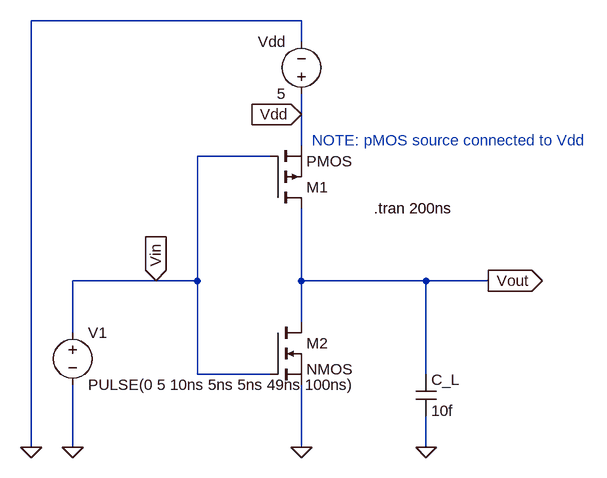
[diagram p0: schematic Inverter.asc]
Inverter.asc, the LTspice schematic file:
Version 4.1
SHEET 1 1008 680
WIRE 208 -400 -208 -400
WIRE 208 -368 208 -400
WIRE 208 -256 208 -288
WIRE 208 -208 208 -256
WIRE 160 -192 48 -192
WIRE -16 0 -144 0
WIRE 48 0 48 -192
WIRE 48 0 -16 0
WIRE 208 0 208 -112
WIRE 400 0 208 0
WIRE 496 0 400 0
WIRE 208 64 208 0
WIRE -144 80 -144 0
WIRE 48 144 48 0
WIRE 160 144 48 144
WIRE 400 144 400 0
WIRE -208 256 -208 -400
WIRE -144 256 -144 160
WIRE 208 256 208 160
WIRE 400 256 400 208
FLAG 496 0 Vout
IOPIN 496 0 Out
FLAG -16 0 Vin
IOPIN -16 0 In
FLAG -208 256 0
FLAG -144 256 0
FLAG 208 256 0
FLAG 400 256 0
FLAG 208 -256 Vdd
IOPIN 208 -256 In
SYMBOL cap 384 144 R0
SYMATTR InstName C_L
SYMATTR Value 10f
SYMBOL nmos 160 64 R0
SYMATTR InstName M2
SYMBOL pmos 160 -112 M180
SYMATTR InstName M1
SYMBOL voltage -144 64 R0
WINDOW 123 0 0 Left 0
WINDOW 39 0 0 Left 0
SYMATTR InstName V1
SYMATTR Value PULSE(0 5 10ns 5ns 5ns 49ns 100ns)
SYMBOL voltage 208 -272 R180
WINDOW 0 24 96 Left 2
WINDOW 3 24 16 Left 2
WINDOW 123 0 0 Left 0
WINDOW 39 0 0 Left 0
SYMATTR InstName Vdd
SYMATTR Value 5
TEXT 224 -216 Left 2 ;NOTE: pMOS source connected to Vdd
TEXT 320 -112 Left 2 !.tran 200ns

The netlist it stands for:
* Inverter.asc
C_L Vout 0 10f
M2 Vout Vin 0 0 NMOS
M1 Vout Vin Vdd Vdd PMOS
V1 Vin 0 PULSE(0 5 10ns 5ns 5ns 49ns 100ns)
Vdd Vdd 0 5
.model NMOS NMOS
.model PMOS PMOS
.lib standard.mos
* NOTE: pMOS source connected to Vdd
.tran 200ns
.backanno
.end

* Results of the author's LTspice run, read from the files saved beside the schematic
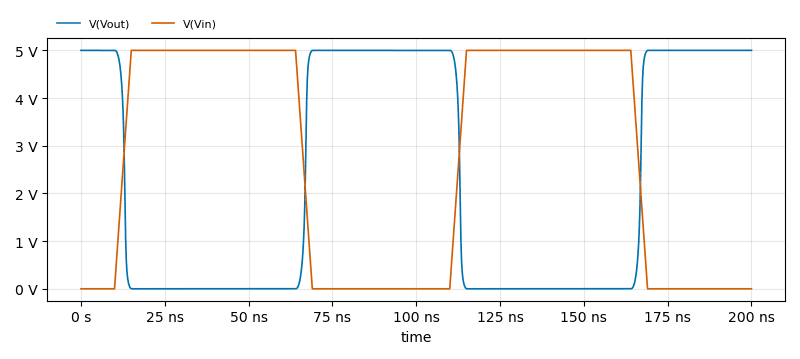
[diagram p1: Transient Analysis of Inverter.asc, plotted from the saved traces]
* Transient Analysis, 1 run:
*   V(Vout): min 0 V, max 5 V, average 2.3 V, rms 3.363 V, last 5 V
*   V(Vin): min 0 V, max 5 V, average 2.7 V, rms 3.617 V, last 0 V